# EasyEDA Pro project ran-pang-airlink-86231b34.epro, schematic Schematic1_6, sheets 1 to 3 of 9

## Sheets
1 SOC: Board Name: 主控板; Create Date: 2025-08-27; Page Name: SOC; Project Name: 无线USB集线器-SG2002; Schematic Name: Schematic1_1; Update Date: 2025-10-29; Page Size: A4; Version: V1.0
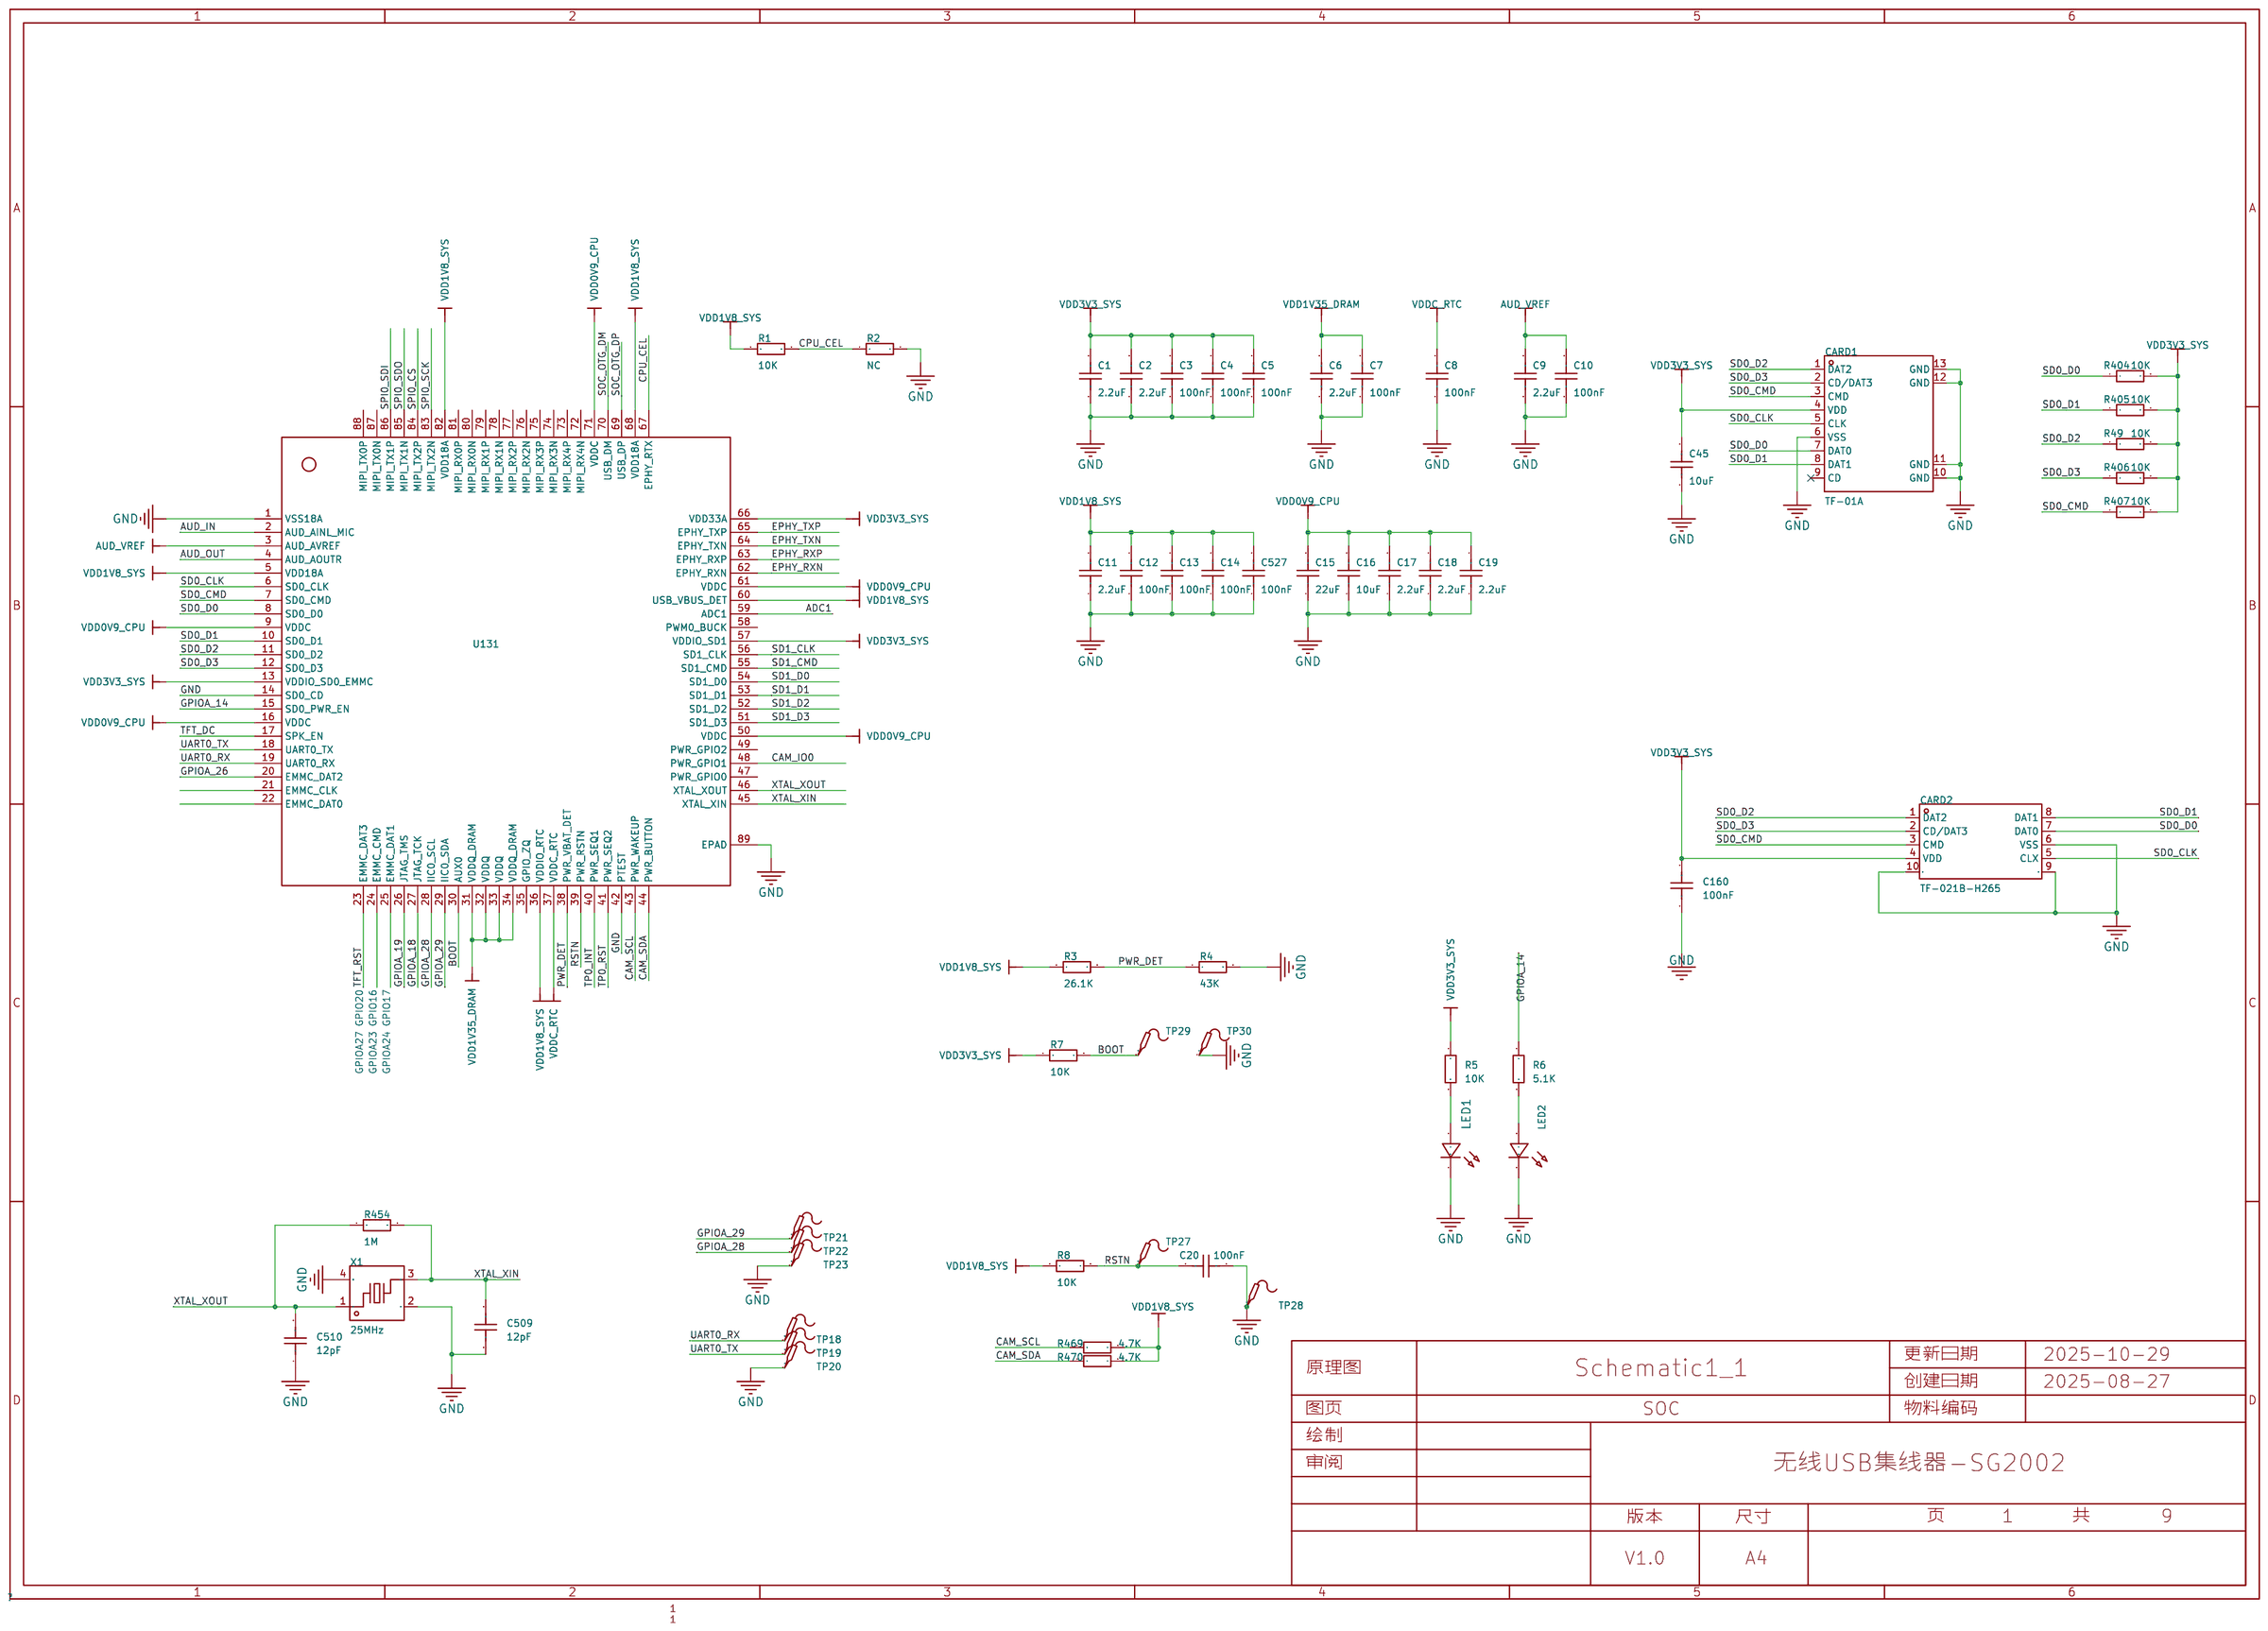
[diagram p0: SOC]
2 POWER: Page Name: POWER; Update Date: 2025-10-30
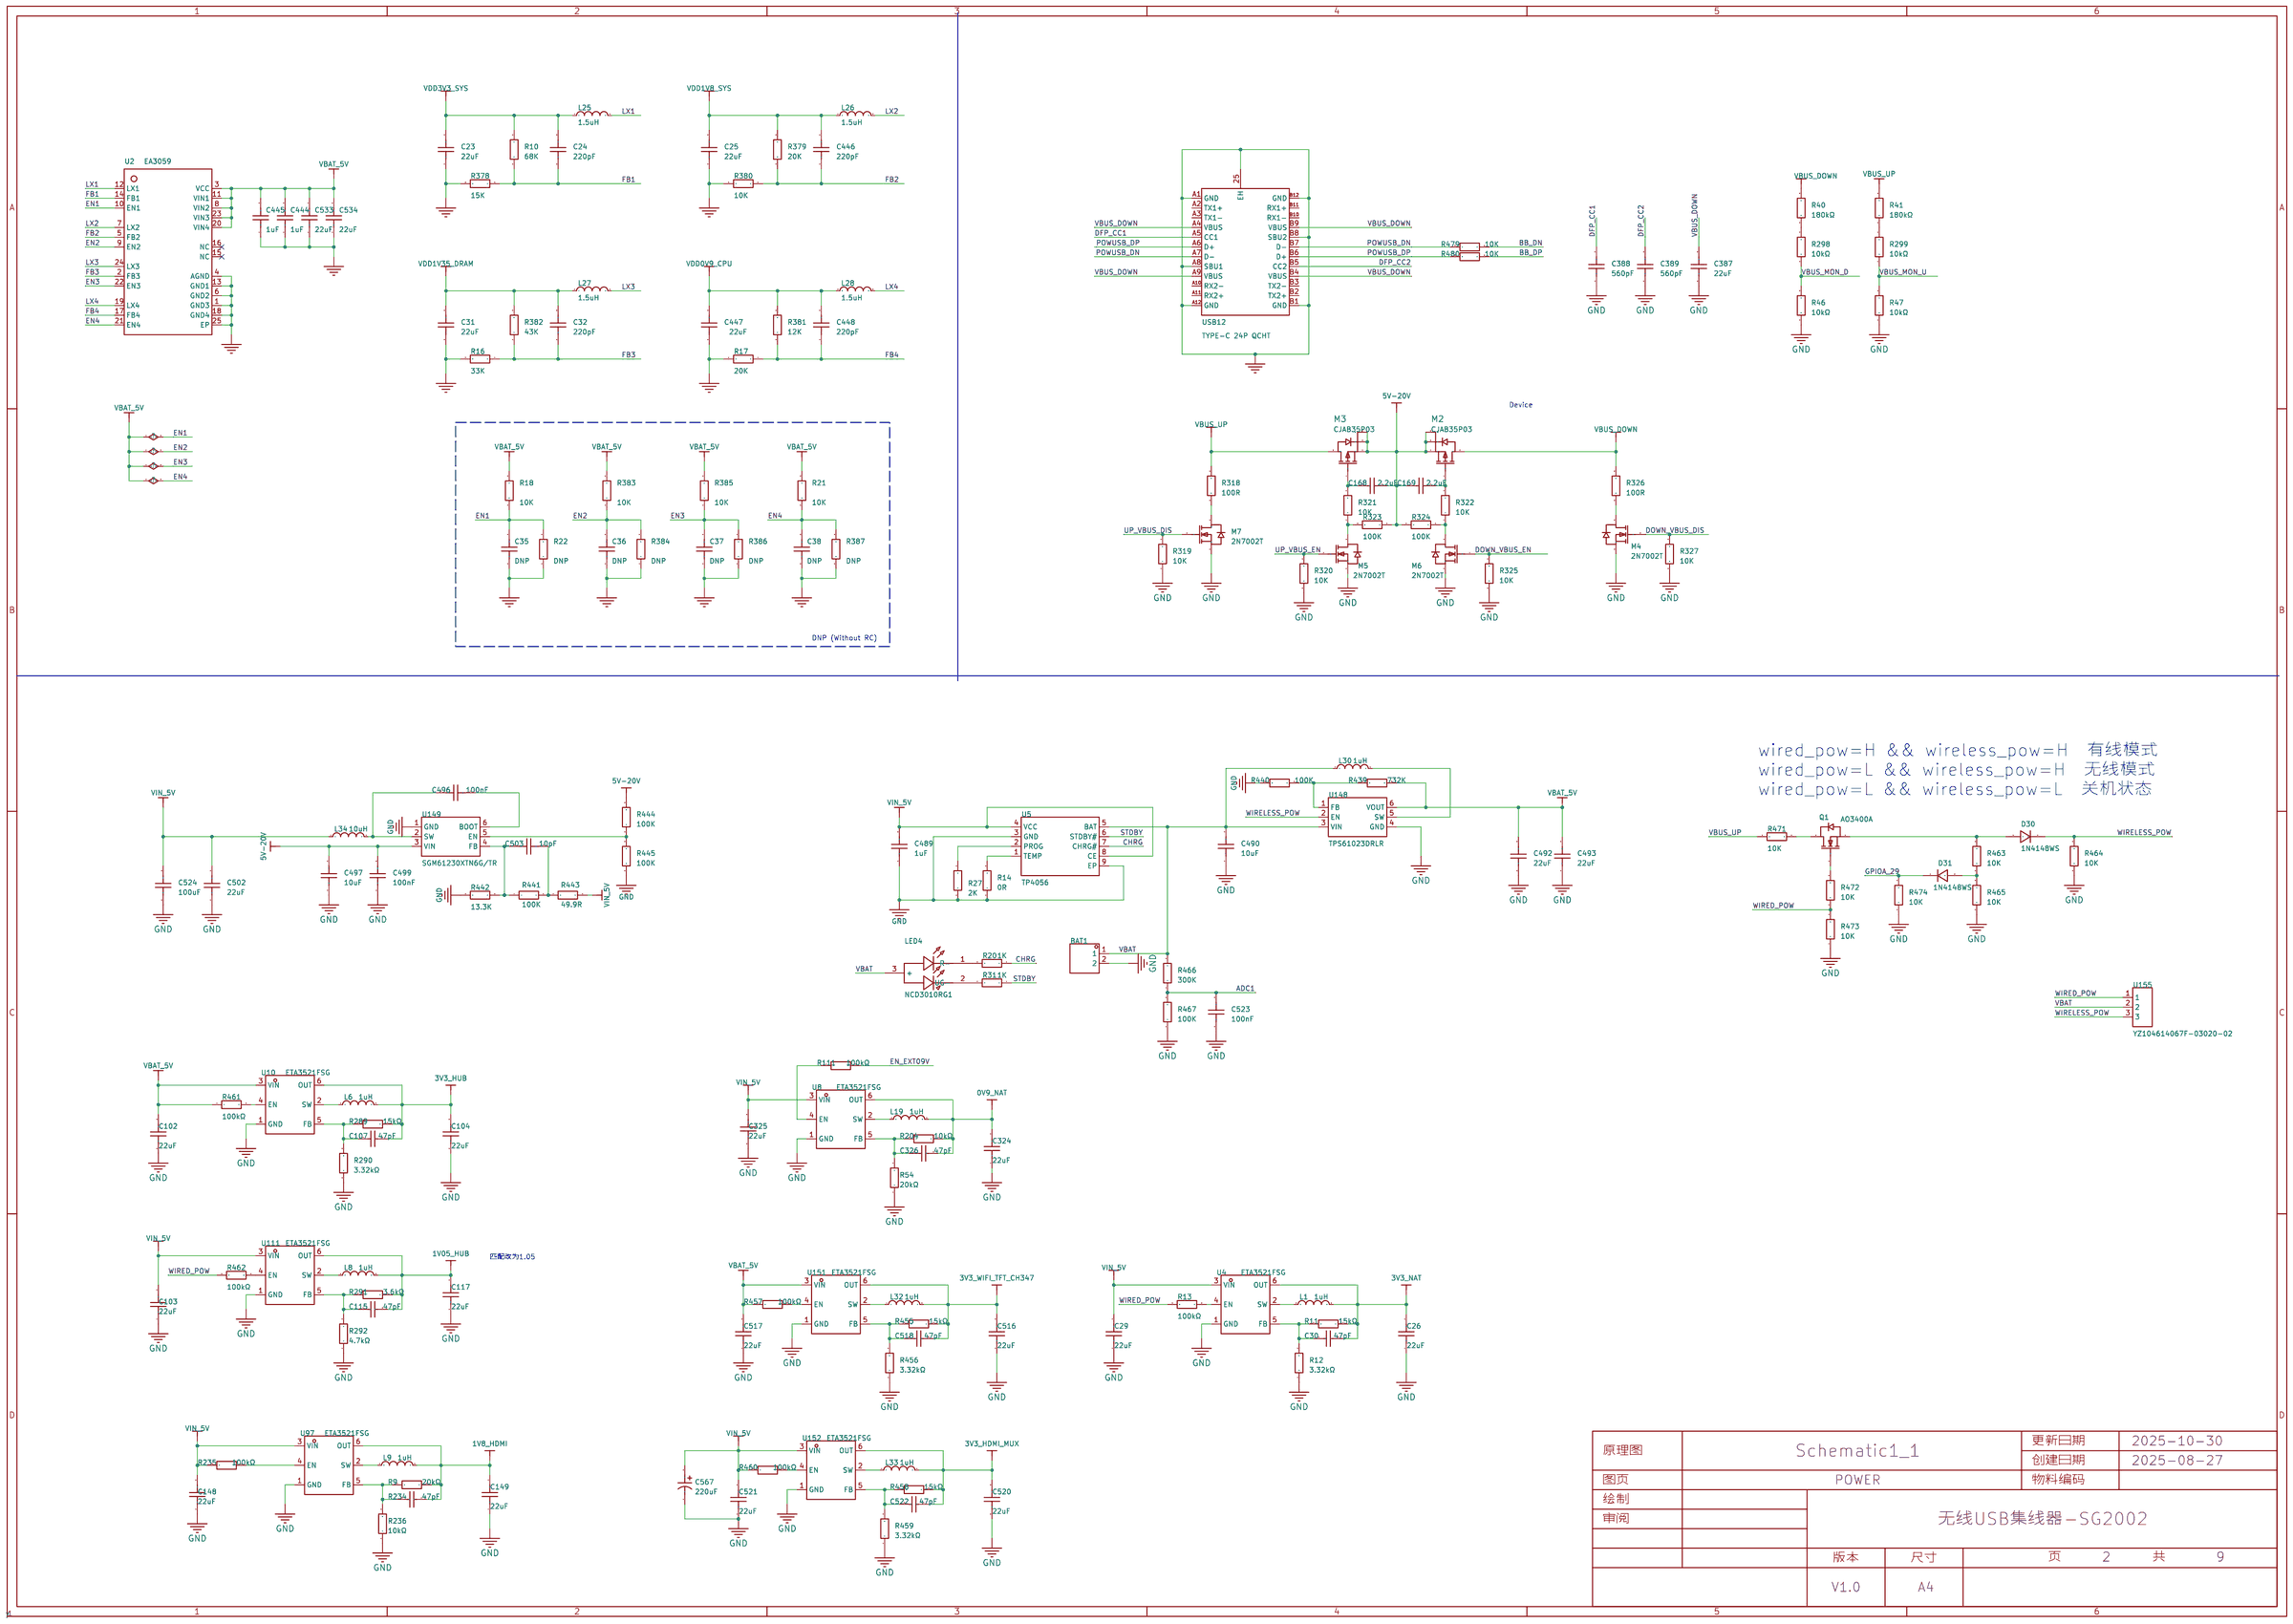
[diagram p1: POWER]
3 WIFI: Page Name: WIFI; Update Date: 2025-09-01
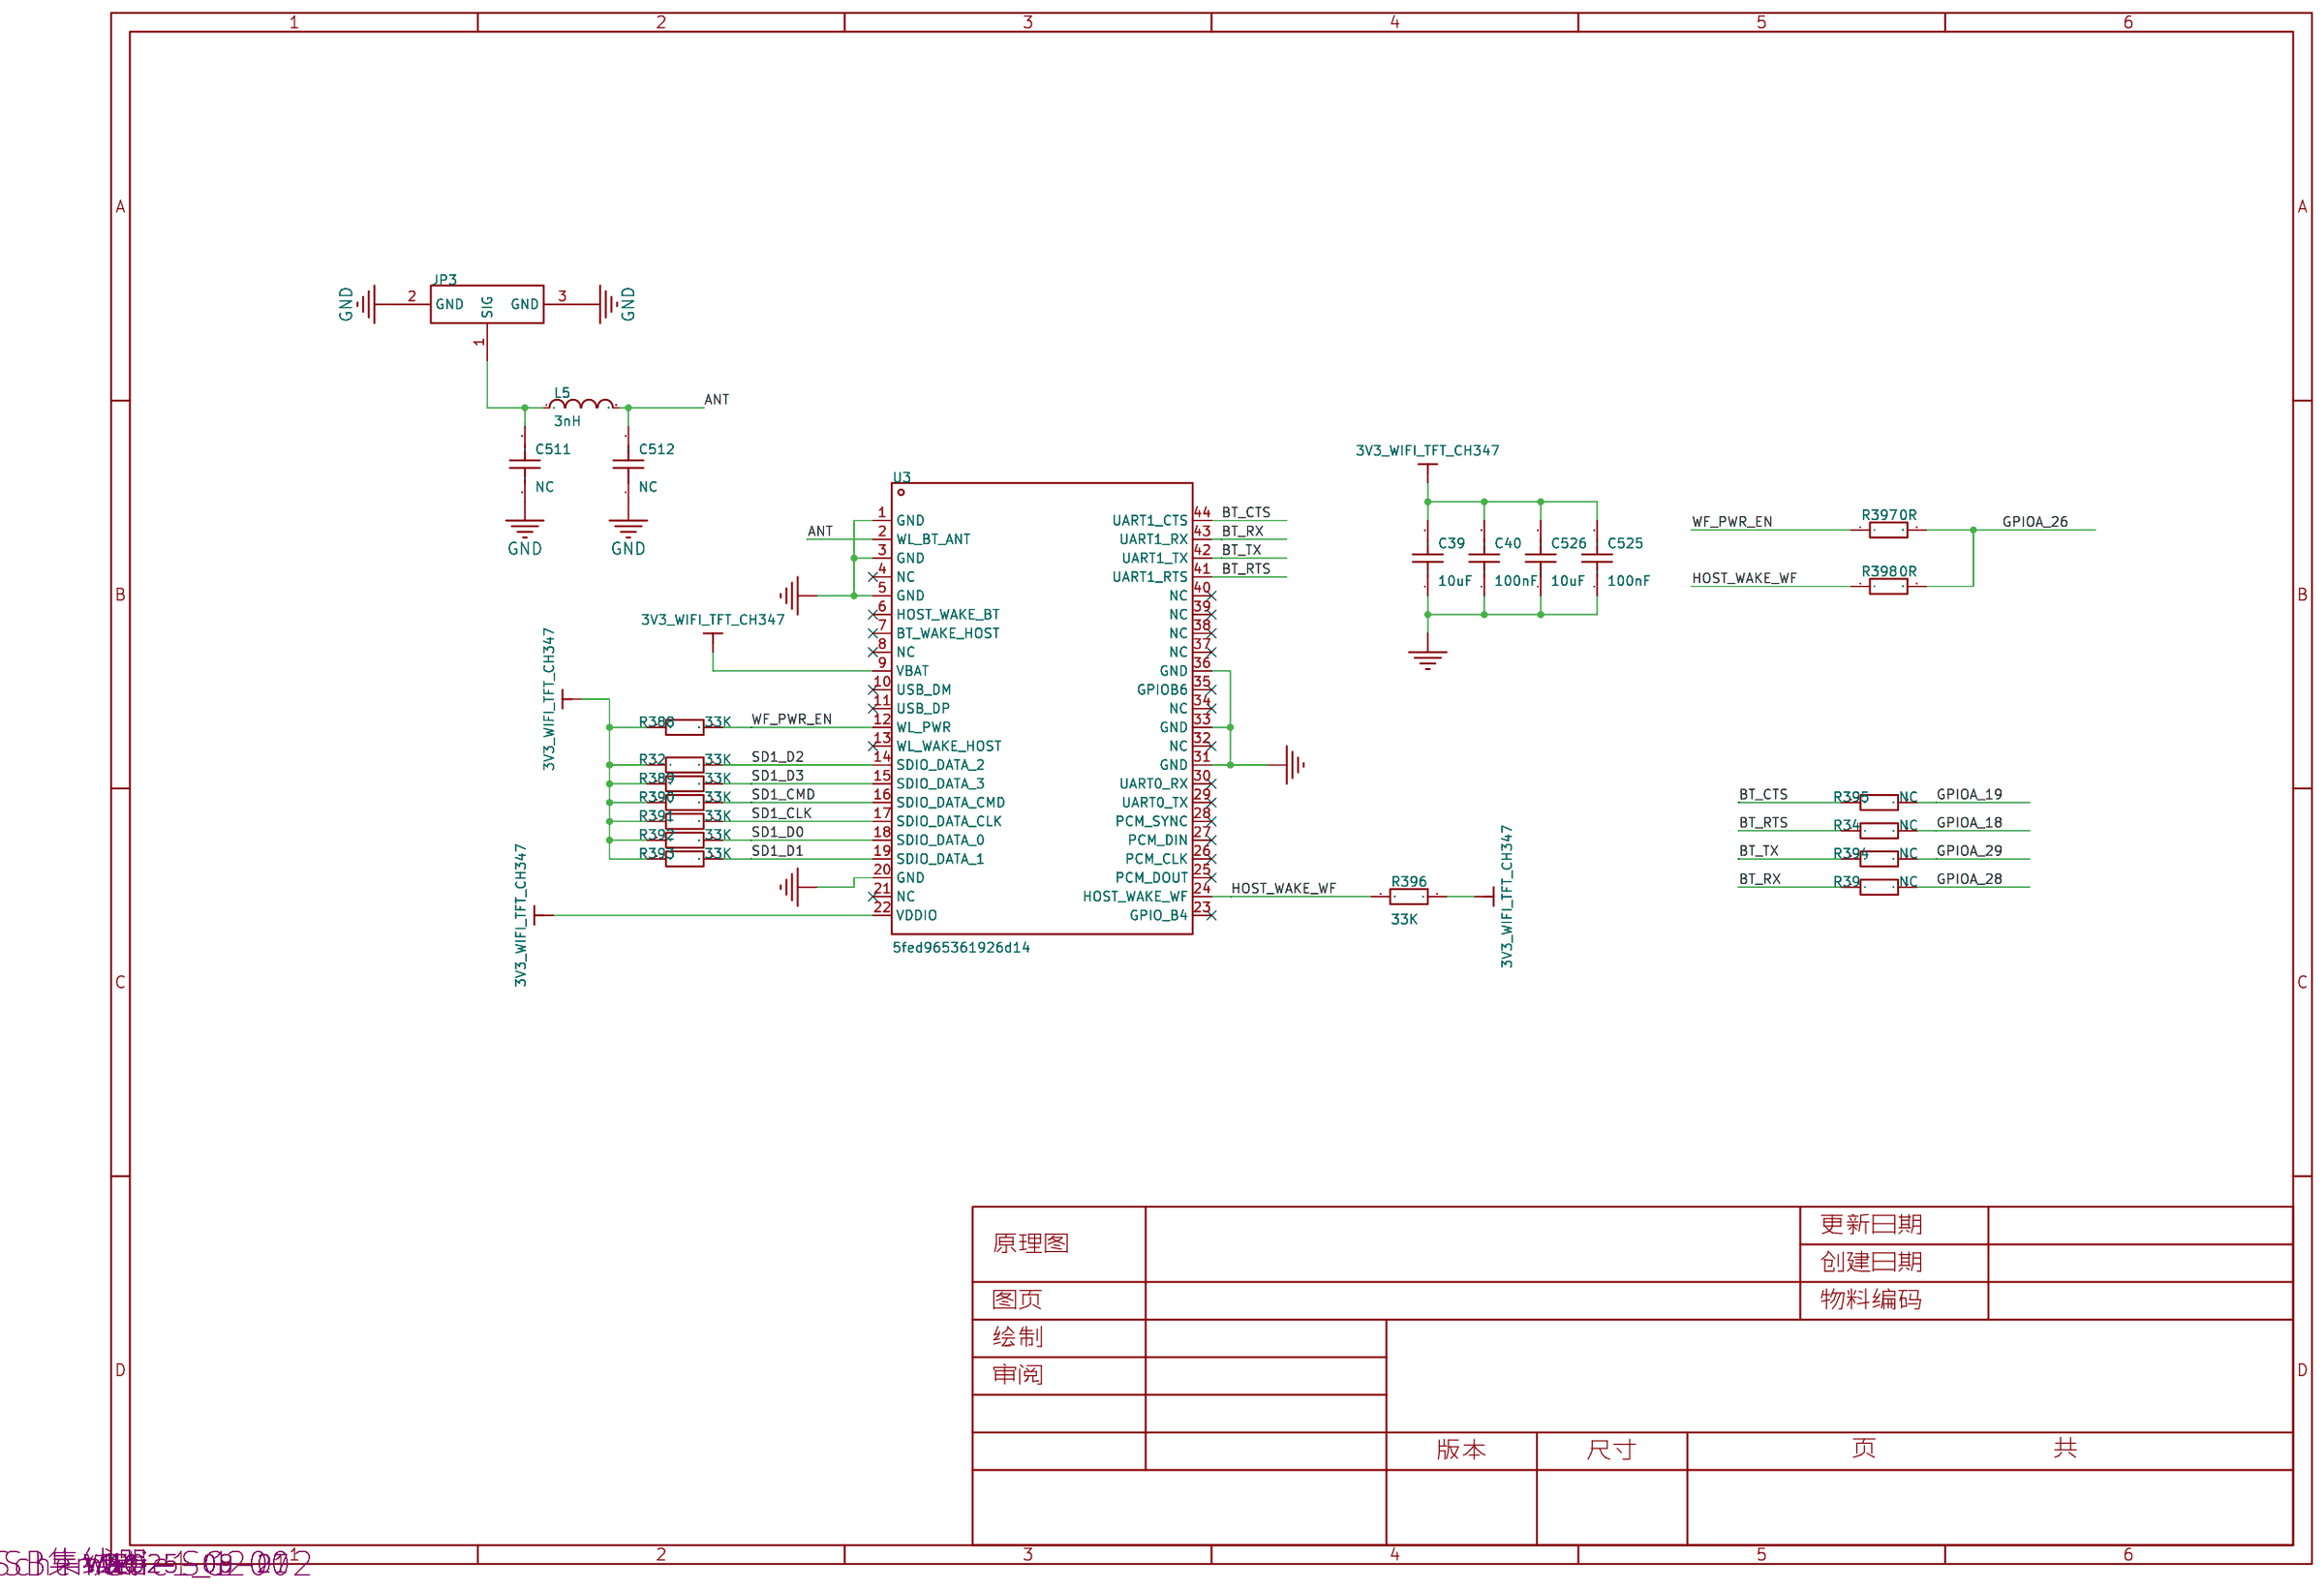
[diagram p2: WIFI]

## Parts
sheet POWER
BAT1  -  [HDR-TH_2P-P2.54-V-M-1]
C23  22uF  [C0603]
C24  220pF  [C0402]  (no BOM)
C25  22uF  [C0603]
C26  22uF  [C0603]
C29  22uF  [C0603]
C30  47pF  [R0402]
C31  22uF  [C0603]
C32  220pF  [C0402]  (no BOM)
C35  DNP  [C0402]  (no BOM)
C36  DNP  [C0402]  (no BOM)
C37  DNP  [C0402]  (no BOM)
C38  DNP  [C0402]  (no BOM)
C102  22uF  [C0603]
C103  22uF  [C0603]  (no BOM)
C104  22uF  [C0603]
C107  47pF  [R0402]
C115  47pF  [R0402]  (no BOM)
C117  22uF  [C0603]  (no BOM)
C148  22uF  [C0603]
C149  22uF  [C0603]
C168  2.2uF  [R0402]
C169  2.2uF  [R0402]
C324  22uF  [C0603]  (no BOM)
C325  22uF  [C0603]  (no BOM)
C326  47pF  [R0402]  (no BOM)
C387  22uF  [C0805]
C388  560pF  [C0402]
C389  560pF  [C0402]
C444  1uF  [C0402]
C445  1uF  [C0402]
C446  220pF  [C0402]  (no BOM)
C447  22uF  [C0603]
C448  220pF  [C0402]  (no BOM)
C489  1uF  [C0402]
C490  10uF  [C0402]
C492  22uF  [C0603]
C493  22uF  [C0603]
C496  100nF  [C0402]
C497  10uF  [C0603]
C499  100nF  [C0402]
C502  22uF  [C0603]
C503  10pF  [C0402]
C516  22uF  [C0603]
C517  22uF  [C0603]
C518  47pF  [R0402]
C520  22uF  [C0603]
C521  22uF  [C0603]
C522  47pF  [R0402]
C523  100nF  [C0402]
C524  100uF  [C1206]
C533  22uF  [C0402]
C534  22uF  [C0402]
C567  220uF  [CAP-SMD_L7.3-W4.3-RD_177EC0013]
D30  1N4148WS  [SOD-323_L1.8-W1.3-LS2.5-RD]
D31  1N4148WS  [SOD-323_L1.8-W1.3-LS2.5-RD]
L1  1uH  [IND-SMD_L2.5-W2.0-VLS252012CX-150M]
L6  1uH  [IND-SMD_L2.5-W2.0-VLS252012CX-150M]
L8  1uH  [IND-SMD_L2.5-W2.0-VLS252012CX-150M]  (no BOM)
L9  1uH  [IND-SMD_L2.5-W2.0-VLS252012CX-150M]
L19  1uH  [IND-SMD_L2.5-W2.0-VLS252012CX-150M]  (no BOM)
L25  1.5uH  [IND-SMD_L2.5-W2.0_YXMBL252010P]
L26  1.5uH  [IND-SMD_L2.5-W2.0_YXMBL252010P]
L27  1.5uH  [IND-SMD_L2.5-W2.0_YXMBL252010P]
L28  1.5uH  [IND-SMD_L2.5-W2.0_YXMBL252010P]
L30  1uH  [IND-SMD_L2.5-W2.0-VLS252012CX-150M]
L32  1uH  [IND-SMD_L2.5-W2.0-VLS252012CX-150M]
L33  1uH  [IND-SMD_L2.5-W2.0-VLS252012CX-150M]
L34  10uH  [IND-SMD_L3.2-W2.5_CKST322512-2.2UH]
LED4  NCD3010RG1  [LED-SMD_NCD3010RG1]
M2  CJAB35P03  [POWERDI3333-8_DMN7022LFGQ-7]
M3  CJAB35P03  [POWERDI3333-8_DMN7022LFGQ-7]
M4  2N7002T  [SC-75-3_L1.6-W0.8-P1.00-LS1.7-BR]
M5  2N7002T  [SC-75-3_L1.6-W0.8-P1.00-LS1.7-BR]
M6  2N7002T  [SC-75-3_L1.6-W0.8-P1.00-LS1.7-BR]
M7  2N7002T  [SC-75-3_L1.6-W0.8-P1.00-LS1.7-BR]
Q1  AO3400A  [SOT-23-3_L2.9-W1.3-P1.90-LS2.4-BR]
R9  20kΩ  [R0402]
R10  68K  [R0402]
R11  15kΩ  [R0402]
R12  3.32kΩ  [R0402]
R13  100kΩ  [R0402]
R14  0R  [R0402]
R16  33K  [R0402]
R17  20K  [R0402]
R18  10K  [R0402]  (no BOM)
R20  1K  [R0402]
R21  10K  [R0402]  (no BOM)
R22  DNP  [R0402]  (no BOM)
R27  2K  [R0402]
R31  1K  [R0402]
R40  180kΩ  [R0402]
R41  180kΩ  [R0402]
R46  10kΩ  [R0402]
R47  10kΩ  [R0402]
R54  20kΩ  [R0402]  (no BOM)
R111  100kΩ  [R0402]  (no BOM)
R204  10kΩ  [R0402]  (no BOM)
R234  47pF  [R0402]
R235  100kΩ  [R0402]
R236  10kΩ  [R0402]
R289  15kΩ  [R0402]
R290  3.32kΩ  [R0402]
R291  3.6kΩ  [R0402]  (no BOM)
R292  4.7kΩ  [R0402]  (no BOM)
R298  10kΩ  [R0402]
R299  10kΩ  [R0402]
R318  100R  [R0603]
R319  10K  [R0402]
R320  10K  [R0402]
R321  10K  [R0402]
R322  10K  [R0402]
R323  100K  [R0402]
R324  100K  [R0402]
R325  10K  [R0402]
R326  100R  [R0603]
R327  10K  [R0402]
R378  15K  [R0402]
R379  20K  [R0402]
R380  10K  [R0402]
R381  12K  [R0402]
R382  43K  [R0402]
R383  10K  [R0402]  (no BOM)
R384  DNP  [R0402]  (no BOM)
R385  10K  [R0402]  (no BOM)
R386  DNP  [R0402]  (no BOM)
R387  DNP  [R0402]  (no BOM)
R439  732K  [R0402]
R440  100K  [R0402]
R441  100K  [R0402]
R442  13.3K  [R0402]
R443  49.9R  [R0402]
R444  100K  [R0402]
R445  100K  [R0402]
R455  15kΩ  [R0402]
R456  3.32kΩ  [R0402]
R457  100kΩ  [R0402]
R458  15kΩ  [R0402]
R459  3.32kΩ  [R0402]
R460  100kΩ  [R0402]
R461  100kΩ  [R0402]
R462  100kΩ  [R0402]  (no BOM)
R463  10K  [R0402]
R464  10K  [R0402]
R465  10K  [R0402]
R466  300K  [R0402]
R467  100K  [R0402]
R471  10K  [R0402]
R472  10K  [R0402]
R473  10K  [R0402]
R474  10K  [R0402]
R479  10K  [R0402]
R480  10K  [R0402]
U2  EA3059  [VQFN-24_L4.0-W4.0-P0.50-TL-EP2.5]
U4  ETA3521FSG  [SOT-563-6_L1.6-W1.2-P0.5-LS1.6-BL]
U5  TP4056  [ESOP-8_L4.9-W3.9-P1.27-LS6.0-BL-EP]
U8  ETA3521FSG  [SOT-563-6_L1.6-W1.2-P0.5-LS1.6-BL]  (no BOM)
U10  ETA3521FSG  [SOT-563-6_L1.6-W1.2-P0.5-LS1.6-BL]
U97  ETA3521FSG  [SOT-563-6_L1.6-W1.2-P0.5-LS1.6-BL]
U111  ETA3521FSG  [SOT-563-6_L1.6-W1.2-P0.5-LS1.6-BL]  (no BOM)
U148  TPS61023DRLR  [SOT-563_L1.6-W1.2-P0.50-LS1.6-BR]
U149  SGM61230XTN6G/TR  [SOT-23-6_L2.9-W1.6-P0.95-LS2.8-BR]
U151  ETA3521FSG  [SOT-563-6_L1.6-W1.2-P0.5-LS1.6-BL]
U152  ETA3521FSG  [SOT-563-6_L1.6-W1.2-P0.5-LS1.6-BL]
U155  YZ104614067F-03020-02  [CONN-SMD_YZ104614067F-03020-02]
USB12  TYPE-C 24P QCHT  [TYPE-C-SMD_TYPE-C-24P-QCHT]
sheet SOC
C1  2.2uF  [C0402]
C2  2.2uF  [C0402]
C3  100nF  [C0402]
C4  100nF  [C0402]
C5  100nF  [C0402]
C6  2.2uF  [C0402]
C7  100nF  [C0402]
C8  100nF  [C0402]
C9  2.2uF  [C0402]
C10  100nF  [C0402]
C11  2.2uF  [C0402]
C12  100nF  [C0402]
C13  100nF  [C0402]
C14  100nF  [C0402]
C15  22uF  [C0603]
C16  10uF  [C0603]
C17  2.2uF  [C0402]
C18  2.2uF  [C0402]
C19  2.2uF  [C0402]
C20  100nF  [C0402]
C45  10uF  [C0603]  (no BOM)
C160  100nF  [C0402]
C509  12pF  [C0402]
C510  12pF  [C0402]
C527  100nF  [C0402]
CARD1  TF-01A  [TF-SMD_TF-02]  (no BOM)
CARD2  TF-021B-H265  [TF-SMD_TF-021B-H265]
LED1  -  [LED_0402]
LED2  -  [LED_0402]
R1  10K  [R0402]
R2  NC  [R0402]
R3  26.1K  [R0402]
R4  43K  [R0402]
R5  10K  [R0402]
R6  5.1K  [R0402]
R7  10K  [R0402]
R8  10K  [R0402]
R49  10K  [R0402]  (no BOM)
R404  10K  [R0402]  (no BOM)
R405  10K  [R0402]  (no BOM)
R406  10K  [R0402]  (no BOM)
R407  10K  [R0402]  (no BOM)
R454  1M  [R0402]
R469  4.7K  [R0402]
R470  4.7K  [R0402]
TP18  -  [Test-Point-0.5mm]
TP19  -  [Test-Point-0.5mm]
TP20  -  [Test-Point-0.5mm]
TP21  -  [Test-Point-0.5mm]
TP22  -  [Test-Point-0.5mm]
TP23  -  [Test-Point-0.5mm]
TP27  -  [Test-Point-0.5mm]
TP28  -  [Test-Point-0.5mm]
TP29  -  [Test-Point-0.5mm]
TP30  -  [Test-Point-0.5mm]
U131  de476d111a8f50c6  [QFN-88_L9.0-W9.0-P0.35-TL-EP7.0]
X1  25MHz  [CRYSTAL-SMD_4P-L2.0-W1.6-BL]
sheet WIFI
C39  10uF  [C0603]
C40  100nF  [C0402]
C511  NC  [C0402]
C512  NC  [C0402]
C525  100nF  [C0402]
C526  10uF  [C0603]
JP3  U.FL-R-SMT-1(80)  [RF-SMD_FRF05002-JSS103M]
L5  3nH  [L0402]
R32  33K  [R0402]
R34  NC  [R0402]  (no BOM)
R39  NC  [R0402]  (no BOM)
R388  33K  [R0402]
R389  33K  [R0402]
R390  33K  [R0402]
R391  33K  [R0402]
R392  33K  [R0402]
R393  33K  [R0402]
R394  NC  [R0402]  (no BOM)
R395  NC  [R0402]  (no BOM)
R396  33K  [R0402]
R397  0R  [R0402]
R398  0R  [R0402]
U3  5fed965361926d14  [QFN-44_L12.0-W12.0-WiFi]

## Library data of the parts
BAT1 = HDR-M_2.54_1x2P: Supplier Part: C124375; Supplier Footprint: 插件
C15 C16 C23 C25 C31 C39 C45 C447 C492 C493 C497 C502 C526 = CAP_0603: Supplier Footprint: 0603
C1-C14 C17-C20 C24 C32 C35-C38 C40 C160 C388 C389 C444-C446 C448 C489 C490 C496 C499 C503 C509-C512 C523 C525 C527 C533 C534 = CAP_0402: Supplier Footprint: 0402
C26 C29 C102-C104 C117 C148 C149 C324 C325 C516 C517 C520 C521 = CL10A226MP8NUNE: 容值:22uF;精度:±20%;额定电压:10V;材质(温度系数):X5R;; LCSC Part Name: 22uF ±20% 10V; Supplier Part: C86295; Manufacturer: SAMSUNG(三星); Supplier Footprint: 0603; JLCPCB Part Class: 扩展库; Datasheet: https://atta.szlcsc.com/upload/public/pdf/source/20160218/1457707763339.pdf; Supplier: LCSC; Tolerance: ±20%; Voltage Rated: 10V; Temperature Coefficient: X5R
C30 C107 C115 C326 C518 C522 R234 = GRM1555C1H470JA01D: 容值:47pF;精度:±5%;额定电压:50V;材质(温度系数):C0G;; LCSC Part Name: 47pF ±5% 50V; Supplier Part: C76970; Manufacturer: muRata(村田); Supplier Footprint: 0402; JLCPCB Part Class: Extended Part; Datasheet: https://atta.szlcsc.com/upload/public/pdf/source/20180326/C76970_6FDF160D4C40A32DF03646FA34DB0595.pdf; Supplier: LCSC; Tolerance: ±5%; Voltage Rated: 50V; Temperature Coefficient: C0G
C168 C169 = CL05A105KP5NNNC: 容值:1uF;精度:±10%;额定电压:10V;材质(温度系数):X5R;; LCSC Part Name: 1uF ±10% 10V; Supplier Part: C14445; Manufacturer: SAMSUNG(三星); Supplier Footprint: 0402; JLCPCB Part Class: Extended Part; Datasheet: https://atta.szlcsc.com/upload/public/pdf/source/20160218/1457707763339.pdf; Supplier: LCSC; Tolerance: ±10%; Voltage Rated: 10V; Temperature Coefficient: X5R
C387 = CAP_0805: Supplier Footprint: 0805
C524 = HGC1206R5107M100NSPJ: 容值:100uF;精度:±20%;额定电压:10V;温度系数:X5R;; LCSC Part Name: 100uF ±20% 10V; Supplier Part: C7432784; Manufacturer: Chinocera(华瓷); Supplier Footprint: 1206; JLCPCB Part Class: Extended Part; Datasheet: https://atta.szlcsc.com/upload/public/pdf/source/20240320/FAC3FEC40A78BC5CCCE96C232A94D860.pdf; Supplier: LCSC; Tolerance: ±20%; Voltage Rating: 10V; Temperature Coefficient: X5R
C567 = TA6R3M220A: 容值:220uF;精度:±20%;额定电压:6.3V;等效串联电阻(ESR):18mΩ@100kHz;; LCSC Part Name: 220uF ±20% 6.3V; Supplier Part: C49332975; Manufacturer: JIERR(捷而瑞); Supplier Footprint: CASE-A-7343-19(mm); JLCPCB Part Class: Extended Part; Datasheet: https://item.szlcsc.com/datasheet/TA6R3M220A/51817329.html; Supplier: LCSC; Tolerance: ±20%; Voltage Rating: 6.3V; Current - Leakage: 138.6uA@20℃,2min; Ripple Current: 5.1A@100kHz; Equivalent Series Resistance(ESR): 18mΩ@100kHz; Operating Temperature: -55℃~+105℃
D30 D31 = 1N4148WS_C2128: 二极管配置:独立式;正向压降(Vf):1.25V@150mA;直流反向耐压(Vr):100V;整流电流:150mA;反向恢复时间(Trr):4ns;; LCSC Part Name: 丝印T4 1N4148WS; Supplier Part: C2128; Manufacturer: CJ(江苏长电/长晶); Supplier Footprint: SOD-323; JLCPCB Part Class: Basic Part; Datasheet: https://item.szlcsc.com/datasheet/1N4148WS/2485.html; Supplier: LCSC; Diode Configuration: 独立式; Voltage - Forward(Vf@If): 1.25V@150mA; Voltage - DC Reverse(Vr): 100V; Current - Rectified: 150mA; Pd - Power Dissipation: 200mW; Reverse Leakage Current (Ir): 1uA@75V; Reverse Recovery Time (trr): 4ns; Non-Repetitive Peak Forward Surge Current: 2A
L1 L6 L8 L9 L19 L30 L32 L33 = FTC252012S1R0MBCA: 电感值:1uH;精度:±20%;额定电流:4A;饱和电流(Isat):5.6A;类型:一体成型电感;; LCSC Part Name: 1uH ±20% 5.6A; Supplier Part: C5832370; Manufacturer: cjiang(长江微电); Supplier Footprint: SMD,2x2.5mm; JLCPCB Part Class: 扩展库; Datasheet: https://atta.szlcsc.com/upload/public/pdf/source/20230602/8FFEDA9C0247A92A0D4B67554BFE4091.pdf; Supplier: LCSC; Tolerance: ±20%; Rated Current: 4A; Saturation Current (Isat): 5.6A; DC Resistance (DCR): 35mΩ; Type: 一体成型电感
L25-L28 = FWP252010P-1R5ML: 电感值:1.5uH;精度:±20%;额定电流:2.5A;饱和电流(Isat):2.6A;类型:一体成型电感;; LCSC Part Name: 1.5uH ±20% 2.6A; Supplier Part: C5179452; Manufacturer: cjiang(长江微电); Supplier Footprint: 1008; Datasheet: https://atta.szlcsc.com/upload/public/pdf/source/20220919/6437779B41DFA72ADCBB2BAC61339FA9.pdf; Supplier: LCSC; Tolerance: ±20%; Rated Current: 2.5A; Saturation Current (Isat): 2.6A; DC Resistance (DCR): 76mΩ; Type: 一体成型电感
L34 = XRTC322512S100MBCA: 电感值:10uH;精度:±20%;额定电流:2.2A;饱和电流(Isat):2.3A;类型:一体成型电感;; LCSC Part Name: 10uH ±20% 2.3A; Supplier Part: C39846661; Manufacturer: XR(祥如); Supplier Footprint: 1210; JLCPCB Part Class: Extended Part; Datasheet: https://atta.szlcsc.com/upload/public/pdf/source/20240812/C16E8F0C73C405E9D3CCCD49A6B54F40.pdf; Supplier: LCSC; Tolerance: ±20%; Current Rating: 2.2A; Current - Saturation(Isat): 2.3A; DC Resistance(DCR): 210mΩ; Type: 一体成型电感
LED4 = NCD3010RG1: 发光颜色:橙红色,翠绿色;正向压降(Vf):3V；2V;功率:90mW；65mW;正向电流:25mA;波长:625nm；530nm;二极管配置:共阳极;透镜颜色:-;色温:-;发光强度:180mcd；270mcd;发光角度:120°;载带方式:侧贴;工作温度:-30℃~+85℃;; LCSC Part Name: 片式发光二极管; Supplier Part: C2917189; Manufacturer: 国星光电; Supplier Footprint: SMD,3x2mm; JLCPCB Part Class: Extended Part; Datasheet: https://item.szlcsc.com/datasheet/NCD3010RG1/3215928.html; Supplier: LCSC; Illumination Color: 橙红色,翠绿色; Voltage - Forward(Vf): 3V；2V; Power(Watts): 90mW；65mW; Forward Current: 25mA; Wavelength - Dominant: 625nm；530nm; Diode Configuration: 共阳极; Luminous Intensity: 180mcd；270mcd; Viewing Angle: 120°; Mounting Style: 侧贴; Operating Temperature: -30℃~+85℃
M2 M3 = AONR21357_C17702945: 类型:1个P沟道;漏源电压(Vdss):30V;连续漏极电流(Id):50A;导通电阻(RDS(on)@Vgs,Id):13mΩ@10V;阈值电压(Vgs(th)@Id):2.5V;; LCSC Part Name: 1个P沟道 耐压:30V 电流:50A; Supplier Part: C17702945; Manufacturer: MSKSEMI(美森科); Supplier Footprint: DFN3x3-8L; JLCPCB Part Class: Extended Part; Datasheet: https://atta.szlcsc.com/upload/public/pdf/source/20230927/8E319A2206C95A80892B1C001B0B7090.pdf; Supplier: LCSC; Type: 1个P沟道; Drain Source Voltage (Vdss): 30V; Continuous Drain Current (Id): 50A; Drain Source On Resistance (RDS(on)@Vgs,Id): 13mΩ@10V; Gate Threshold Voltage (Vgs(th)@Id): 2.5V
M4-M7 = 2N7002T_C40106: 类型:1个N沟道;漏源电压(Vdss):60V;连续漏极电流(Id):115mA;功率(Pd):200mW;导通电阻(RDS(on)@Vgs,Id):7.5Ω@5V,50mA;阈值电压(Vgs(th)@Id):2V@250uA;; LCSC Part Name: 1个N沟道 耐压:60V 电流:115mA; Supplier Part: C40106; Manufacturer: CJ(江苏长电/长晶); Supplier Footprint: SC-75(SOT-523); JLCPCB Part Class: 扩展库; Datasheet: https://atta.szlcsc.com/upload/public/pdf/source/20141219/1457707256656.pdf; Supplier: LCSC; Type: 1个N沟道; Drain Source Voltage (Vdss): 60V; Continuous Drain Current (Id): 115mA; Power Dissipation (Pd): 200mW; Drain Source On Resistance (RDS(on)@Vgs,Id): 7.5Ω@5V,50mA; Gate Threshold Voltage (Vgs(th)@Id): 2V@250uA
Q1 = AO3400A_C20917: 数量:-;漏源电压(Vdss):30V;连续漏极电流(Id):-;导通电阻(RDS(on)):48mΩ@2.5V;耗散功率(Pd):-;阈值电压(Vgs(th)):1.45V@250uA;; LCSC Part Name: 1个N沟道 耐压:30V 电流:5.7A; Supplier Part: C20917; Manufacturer: AOS; Supplier Footprint: SOT-23-3L; JLCPCB Part Class: Basic Part; Datasheet: https://item.szlcsc.com/datasheet/AO3400A/21629.html; Supplier: LCSC; Drain to Source Voltage: 30V; RDS(on): 48mΩ@2.5V; Gate Threshold Voltage (Vgs(th)): 1.45V@250uA; Gate Charge(Qg): 7nC@10V; Input Capacitance(Ciss): 630pF@15V; Operating Temperature: -55℃~+150℃@(Tj); Type: N沟道
R9 = 0402WGF2002TCE: 电阻类型:厚膜电阻;阻值:20kΩ;精度:±1%;功率:62.5mW;最大工作电压:50V;温度系数:±100ppm/℃;; LCSC Part Name: 20kΩ ±1% 62.5mW 厚膜电阻; Supplier Part: C25765; Manufacturer: UNI-ROYAL(厚声); Supplier Footprint: 0402; JLCPCB Part Class: Basic Part; Datasheet: https://atta.szlcsc.com/upload/public/pdf/source/20200306/C422600_1E6D84923E4A46A82E41ADD87F860B5C.pdf; Supplier: LCSC; Type: 厚膜电阻; Tolerance: ±1%; Power(Watts): 62.5mW; Overload Voltage (Max): 50V; Temperature Coefficient: ±100ppm/℃; Operating Temperature Range: -55℃~+155℃
R1-R8 R10 R14 R16-R18 R20-R22 R27 R31 R32 R34 R39 R49 R319-R325 R327 R378-R398 R404-R407 R439-R445 R454 R463-R467 R469-R474 R479 R480 = Res_0402: Supplier Footprint: 0402
R11 R289 R455 R458 = 0402WGF1502TCE: 电阻类型:厚膜电阻;阻值:15kΩ;精度:±1%;功率:62.5mW;最大工作电压:50V;温度系数:±100ppm/℃;; LCSC Part Name: 15kΩ ±1% 62.5mW 厚膜电阻; Supplier Part: C25756; Manufacturer: UNI-ROYAL(厚声); Supplier Footprint: 0402; JLCPCB Part Class: 基础库; Datasheet: https://atta.szlcsc.com/upload/public/pdf/source/20200306/C422600_1E6D84923E4A46A82E41ADD87F860B5C.pdf; Supplier: LCSC; Type: 厚膜电阻; Tolerance: ±1%; Power(Watts): 62.5mW; Overload Voltage (Max): 50V; Temperature Coefficient: ±100ppm/℃; Operating Temperature Range: -55℃~+155℃
R12 R290 R456 R459 = 0402WGF3321TCE: 电阻类型:厚膜电阻;阻值:3.32kΩ;精度:±1%;功率:62.5mW;最大工作电压:50V;温度系数:±100ppm/℃;; LCSC Part Name: 3.32kΩ ±1% 62.5mW 厚膜电阻; Supplier Part: C60075; Manufacturer: UNI-ROYAL(厚声); Supplier Footprint: 0402; JLCPCB Part Class: 扩展库; Datasheet: https://atta.szlcsc.com/upload/public/pdf/source/20200306/C422600_1E6D84923E4A46A82E41ADD87F860B5C.pdf; Supplier: LCSC; Type: 厚膜电阻; Tolerance: ±1%; Power(Watts): 62.5mW; Overload Voltage (Max): 50V; Temperature Coefficient: ±100ppm/℃; Operating Temperature Range: -55℃~+155℃
R13 R111 R235 R457 R460-R462 = RC0402FR-07100KL: 电阻类型:厚膜电阻;阻值:100kΩ;精度:±1%;功率:62.5mW;; LCSC Part Name: 100kΩ ±1% 62.5mW; Supplier Part: C60491; Manufacturer: YAGEO(国巨); Supplier Footprint: 0402; JLCPCB Part Class: Extended Part; Datasheet: https://atta.szlcsc.com/upload/public/pdf/source/20170518/1495086055123.pdf; Supplier: LCSC; Type: 厚膜电阻; Tolerance: ±1%; Power(Watts): 62.5mW; Temperature Coefficient: ±100ppm/℃; Overload Voltage (Max): 50V; Operating Temperature Range: -55℃~+155℃
R40 R41 = 0402WGF1803TCE: 电阻类型:厚膜电阻;阻值:180kΩ;精度:±1%;功率:62.5mW;最大工作电压:50V;温度系数:±100ppm/℃;; LCSC Part Name: 180kΩ ±1% 62.5mW 厚膜电阻; Supplier Part: C25760; Manufacturer: UNI-ROYAL(厚声); Supplier Footprint: 0402; JLCPCB Part Class: 扩展库; Datasheet: https://atta.szlcsc.com/upload/public/pdf/source/20200306/C422600_1E6D84923E4A46A82E41ADD87F860B5C.pdf; Supplier: LCSC; Type: 厚膜电阻; Tolerance: ±1%; Power(Watts): 62.5mW; Overload Voltage (Max): 50V; Temperature Coefficient: ±100ppm/℃; Operating Temperature Range: -55℃~+155℃
R46 R47 R298 R299 = RC0402FR-0710KL: 电阻类型:厚膜电阻;阻值:10kΩ;精度:±1%;功率:62.5mW;; LCSC Part Name: 10kΩ ±1% 62.5mW; Supplier Part: C60490; Manufacturer: YAGEO(国巨); Supplier Footprint: 0402; JLCPCB Part Class: Extended Part; Datasheet: https://atta.szlcsc.com/upload/public/pdf/source/20170606/1496716515432.pdf; Supplier: LCSC; Type: 厚膜电阻; Tolerance: ±1%; Power(Watts): 62.5mW; Temperature Coefficient: ±100ppm/℃; Overload Voltage (Max): 50V; Operating Temperature Range: -55℃~+155℃
R54 = 0402WGF3301TCE: 电阻类型:厚膜电阻;阻值:3.3kΩ;精度:±1%;功率:62.5mW;最大工作电压:50V;温度系数:±100ppm/℃;; LCSC Part Name: 3.3kΩ ±1% 62.5mW 厚膜电阻; Supplier Part: C25765; Manufacturer: UNI-ROYAL(厚声); Supplier Footprint: 0402; JLCPCB Part Class: Basic Part; Datasheet: https://atta.szlcsc.com/upload/public/pdf/source/20200306/C422600_1E6D84923E4A46A82E41ADD87F860B5C.pdf; Supplier: LCSC; Type: 厚膜电阻; Tolerance: ±1%; Power(Watts): 62.5mW; Overload Voltage (Max): 50V; Temperature Coefficient: ±100ppm/℃; Operating Temperature Range: -55℃~+155℃
R204 = 0402WGF2201TCE: 电阻类型:厚膜电阻;阻值:2.2kΩ;精度:±1%;功率:62.5mW;最大工作电压:50V;温度系数:±100ppm/℃;; LCSC Part Name: 2.2kΩ ±1% 62.5mW 厚膜电阻; Supplier Part: C60490; Manufacturer: UNI-ROYAL(厚声); Supplier Footprint: 0402; JLCPCB Part Class: 基础库; Datasheet: https://atta.szlcsc.com/upload/public/pdf/source/20200306/C422600_1E6D84923E4A46A82E41ADD87F860B5C.pdf; Supplier: LCSC; Type: 厚膜电阻; Tolerance: ±1%; Power(Watts): 62.5mW; Overload Voltage (Max): 50V; Temperature Coefficient: ±100ppm/℃; Operating Temperature Range: -55℃~+155℃
R236 = 0402WGF1002TCE: 功率:1/16W;精度:±1%;温度系数:±100ppm/℃;阻值:10kΩ;最大工作电压:50V;工作温度范围:-55℃~+155℃;; LCSC Part Name: 10KΩ ±1%; Supplier Part: C25744; Manufacturer: UNI-ROYAL(厚声); Supplier Footprint: 0402; JLCPCB Part Class: Basic Part; Datasheet: https://atta.szlcsc.com/upload/public/pdf/source/20170920/C25744_1505901522148983320.pdf; Supplier: LCSC; Power(Watts): 1/16W; Tolerance: ±1%; Temperature Coefficient: ±100ppm/℃; Overload Voltage (Max): 50V; Operating Temperature Range: -55℃~+155℃
R291 = 0402WGF2201TCE: 电阻类型:厚膜电阻;阻值:2.2kΩ;精度:±1%;功率:62.5mW;最大工作电压:50V;温度系数:±100ppm/℃;; LCSC Part Name: 2.2kΩ ±1% 62.5mW 厚膜电阻; Supplier Part: C25879; Manufacturer: UNI-ROYAL(厚声); Supplier Footprint: 0402; JLCPCB Part Class: 基础库; Datasheet: https://atta.szlcsc.com/upload/public/pdf/source/20200306/C422600_1E6D84923E4A46A82E41ADD87F860B5C.pdf; Supplier: LCSC; Type: 厚膜电阻; Tolerance: ±1%; Power(Watts): 62.5mW; Overload Voltage (Max): 50V; Temperature Coefficient: ±100ppm/℃; Operating Temperature Range: -55℃~+155℃
R292 = 0402WGF3301TCE: 电阻类型:厚膜电阻;阻值:3.3kΩ;精度:±1%;功率:62.5mW;最大工作电压:50V;温度系数:±100ppm/℃;; LCSC Part Name: 3.3kΩ ±1% 62.5mW 厚膜电阻; Supplier Part: C25890; Manufacturer: UNI-ROYAL(厚声); Supplier Footprint: 0402; JLCPCB Part Class: Basic Part; Datasheet: https://atta.szlcsc.com/upload/public/pdf/source/20200306/C422600_1E6D84923E4A46A82E41ADD87F860B5C.pdf; Supplier: LCSC; Type: 厚膜电阻; Tolerance: ±1%; Power(Watts): 62.5mW; Overload Voltage (Max): 50V; Temperature Coefficient: ±100ppm/℃; Operating Temperature Range: -55℃~+155℃
R318 R326 = Res_0603: Supplier Footprint: 0603
U2 = EA3059: 电源电压:2.7V~5.5V;最大充电电流:-;电池类型:-;电池节数:4;; Supplier Part: C111586; Manufacturer: everanalog(申风); Supplier Footprint: QFN-24-EP(4x4); JLCPCB Part Class: 扩展库; Supplier: LCSC; Supply Voltage: 2.7V~5.5V; Number of Cells: 4
U4 U8 U10 U97 U111 U151 U152 = ETA3521FSG: Supplier Part: C2856290; Supplier Footprint: SOT-563-6; JLCPCB Part Class: 扩展库; Supplier: LCSC
U5 = TP4056_C725790: 工作电压:3.7V~6.5V;最大充电电流:1A;电池类型:锂离子;电池节数:1;; LCSC Part Name: 1A独立式线性锂离子电池充电器; Supplier Part: C725790; Manufacturer: UMW(友台半导体); Supplier Footprint: ESOP-8; JLCPCB Part Class: Extended Part; Datasheet: https://item.szlcsc.com/datasheet/TP4056/772193.html; Supplier: LCSC; The Chip Type: 线性充电芯片; Voltage - Supply: 3.7V~6.5V; Charge Current - Max: 1A; Charging Saturation Voltage: 4.2V; Type of Battery: 锂离子; Number of Cells: 1; Operating Temperature: -40℃~+85℃; Battery Temperature Detection: 支持; 0V Battery Charge: 支持; Supply Current (Iq): 35uA
U148 = TPS61023DRLR: 功能类型:升压型;输出类型:可调;工作电压:500mV~5.5V;输出电压:2.2V~5.5V;输出电流:3A;; Supplier Part: C919459; Manufacturer: TI(德州仪器); Supplier Footprint: SOT-563; JLCPCB Part Class: Extended Part; Datasheet: https://www.ti.com.cn/cn/lit/ds/symlink/tps61023.pdf?ts=1728812468331&ref_url=https%253A%252F%252Fwww.ti.com.cn%252Fproduct%252Fcn%252FTPS61023; Supplier: LCSC; Function: 升压型; Output Type: 可调; Voltage - Supply: 500mV~5.5V; Output Voltage: 2.2V~5.5V; Output Current: 3A; Frequency - Switching: 1MHz; Operating Temperature: -40℃~+125℃@(TJ); Synchronous Rectifier: 是; Number of Outputs: 1; Topology: 升压式; Switch tube (built-in/external): 内置
U149 = SGM61230XTN6G/TR: 功能类型:降压型;输出类型:-;工作电压:4.5V~28V;输出电流:3A;; LCSC Part Name: 4.5V至28V输入，3A输出同步降压转换器; Supplier Part: C2692352; Manufacturer: SGMICRO(圣邦微); Supplier Footprint: TSOT-23-6; JLCPCB Part Class: Extended Part; Datasheet: https://item.szlcsc.com/datasheet/SGM61230XTN6G%252FTR/2805312.html; Supplier: LCSC; Function: 降压型; Voltage - Supply: 4.5V~28V; Output Current: 3A; Frequency - Switching: 410kHz; Operating Temperature: -40℃~+125℃@(TJ); Synchronous Rectifier: 是; Number of Outputs: 1; Topology: 降压式; Switch tube (built-in/external): 内置
U155 = YZ104614067F-03020-02: 类型:弹簧顶针(POGO PIN);总PIN数:3P;间距:3mm;全长/全高:6.7mm;工作高度:5.5mm;接触电阻:50mΩ;弹性寿命:10000次;额定电流:2A;额定电压:12V;触头材质:黄铜;触头镀层:金;工作温度:-40℃~+85℃;; LCSC Part Name: 侧贴弹簧顶针连接器; Supplier Part: C5296820; Manufacturer: Xinyangze(鑫扬泽); JLCPCB Part Class: Extended Part; Datasheet: https://item.szlcsc.com/datasheet/YZ104614067F-03020-02/6042750.html; Supplier: LCSC; Type: 弹簧顶针(POGO PIN); Number of Pins: 3P; Pitch: 3mm; Overall Length/Height: 6.7mm; Operational Height: 5.5mm; Contact Resistance: 50mΩ; Elastic Life: 10000次; Current Rating: 2A; Voltage Rating: 12V; Contact Material: 黄铜; Contact Plating: 金; Operating Temperature: -40℃~+85℃
USB12 = TYPE-C 24P QCHT: 连接器类型:Type-C;标准:USB 3.1;公母:母;安装方式:卧贴;触点数量:24P;端口数量:1;额定电流 - 电源:3A;工作温度范围:-40℃~+85℃;; LCSC Part Name: Type-C 母 卧贴; Supplier Part: C456013; Manufacturer: SHOU HAN(首韩); Supplier Footprint: SMD; JLCPCB Part Class: Extended Part; Datasheet: https://atta.szlcsc.com/upload/public/pdf/source/20191113/C456013_92427D6B1C851D10A4627E39D5976A1B.pdf; Supplier: LCSC; Connector Type: Type-C; Standard: USB 3.1; Gender: 母; Mounting Style: 卧贴; Number of Contacts: 24P; Number of Ports: 1; Current Rating - Power (Max): 3A; Operating Temperature Range: -40℃~+85℃; Rated Voltage (Max): 30V; Connect-Disconnect Life: 1万次; Core Colour: 黑色
CARD1 = TF-01A_C2889258: 卡连接方式:自弹式;卡类型:MicroSD卡(TF卡);连接器类型:卡座;本体最大高度:2mm;工作温度范围:-;; LCSC Part Name: 自弹式 MicroSD卡(TF卡) 卡座; Supplier Part: C2889258; Manufacturer: Yuandi(元迪); Supplier Footprint: SMD; Datasheet: https://atta.szlcsc.com/upload/public/pdf/source/20210830/44259D2B93BF4B637A446EF1520C4989.pdf; Supplier: LCSC; Card Connection Mode: 自弹式; Card Type: MicroSD卡(TF卡); Connector Type: 卡座; Maximum Body Height: 2mm
CARD2 = TF-021B-H265: 卡连接方式:拔插式;卡类型:MicroSD卡(TF卡);连接器类型:卡座;本体最大高度:2.5mm;工作温度范围:-25℃~+75℃;; LCSC Part Name: 拔插式 MicroSD卡(TF卡) 卡座; Supplier Part: C498185; Manufacturer: SOFNG(硕方); Supplier Footprint: SMD; JLCPCB Part Class: 扩展库; Datasheet: https://atta.szlcsc.com/upload/public/pdf/source/20200318/C498185_790264C8C4D0E25CCBD64FEBD13A33FF.pdf; Supplier: LCSC; Card Connection Mode: 拔插式; Card Type: MicroSD卡(TF卡); Connector Type: 卡座; Maximum Body Height: 2.5mm; Operating Temperature Range: -25℃~+75℃
LED1 = LED_0402-R: Supplier Footprint: 0402
LED2 = LED_0402-B: Supplier Footprint: 0402
TP18-TP23 TP27-TP30 = Test-Point: Test Point 测试点
U131 = SG2002
X1 = XL7EL89CKI-111YLC-25M: 晶振类型:贴片晶振;频率:25MHz;常温频差:±10ppm;外接负载电容:8pF;频率稳定度(全温):±20ppm;; LCSC Part Name: 25MHZ 8PF ±10PPM YSX211SL; Supplier Part: C19711739; Manufacturer: YXC(扬兴晶振); Supplier Footprint: SMD2016-4P; JLCPCB Part Class: 扩展库; Datasheet: https://atta.szlcsc.com/upload/public/pdf/source/20240329/C26C9A15A73CBCFBF373B30A8E126750.pdf; Supplier: LCSC; Crystal Type: 贴片晶振; Normal temperature Frequency Tolerance: ±10ppm; External load capacitor: 8pF; Frequency Stability(Full temperature range): ±20ppm; Operating Temperature: -40℃~+85℃
JP3 = U.FL-R-SMT-1(80)_C88374: LCSC Part Name: 3310472280，IPE-X板端 IPX接头，贴片; Supplier Part: C88374; Manufacturer: HRS(广濑); Supplier Footprint: SMD; JLCPCB Part Class: 扩展库; Datasheet: https://atta.szlcsc.com/upload/public/pdf/source/20161125/1480067868647.pdf; Supplier: LCSC
L5 = L_0402
U3 = AIC8800D-44Pin: 欧智通 N240 模块

## Nets
0V9_NAT: C324.2 C326.2 L19.2 R204.1 U8.6(OUT)
1V05_HUB: C115.2 C117.2 L8.2 R291.1 U111.6(OUT)
1V8_HDMI: C149.2 L9.2 R9.2 R234.2 U97.6(OUT) ; also on sheet 6
3V3_HDMI_MUX: C520.2 C522.1 L33.2 R458.1 U152.6(OUT) ; also on sheet 6
3V3_HUB: C104.2 C107.1 L6.2 R289.1 U10.6(OUT) ; also on sheet 4
3V3_NAT: C26.2 C30.1 L1.2 R11.1 U4.6(OUT) ; also on sheet 5
3V3_WIFI_TFT_CH347: C39.2 C40.2 C516.2 C518.1 C525.2 C526.2 L32.2 R32.1 R388.1 R389.1 R390.1 R391.1 R392.1 R393.1 R396.1 R455.1 U3.9(VBAT) U3.22(VDDIO) U151.6(OUT) ; also on sheet 8 9
5V-20V: C168.2 C169.1 C497.2 C499.2 M2.1(S) M2.2(S) M2.3(S) M3.1(S) M3.2(S) M3.3(S) R323.1 R324.2 R444.2 U149.3(VIN)
GND: BAT1.2 C1.1 C2.1 C3.1 C4.1 C5.1 C6.1 C7.1 C8.1 C9.1 C10.1 C11.1 C12.1 C13.1 C14.1 C15.1 C16.1 C17.1 C18.1 C19.1 C20.1 C23.1 C25.1 C26.1 C29.1 C31.1 C35.1 C36.1 C37.1 C38.1 C39.1 C40.1 C45.1 C102.1 C103.1 C104.1 C117.1 C148.1 C149.1 C160.1 C324.1 C325.1 C387.1 C388.1 C389.1 C444.1 C445.1 C447.1 C489.1 C490.1 C492.1 C493.1 C497.1 C499.1 C502.1 C509.1 C510.1 C511.1 C512.1 C516.1 C517.1 C520.1 C521.1 C523.1 C524.1 C525.1 C526.1 C527.1 C533.1 C534.1 C567.1 CARD1.6(VSS) CARD1.10(GND) CARD1.11(GND) CARD1.12(GND) CARD1.13(GND) CARD2.6(VSS) CARD2.9 CARD2.10 JP3.2(GND) JP3.3(GND) LED1.1(C) LED2.1(C) M4.2(S) M5.2(S) M6.2(S) M7.2(S) R2.2 R4.2 R12.1 R14.1 R16.2 R17.2 R22.1 R27.2 R46.1 R47.1 R54.1 R236.1 R290.1 R292.1 R319.1 R320.1 R325.1 R327.1 R378.2 R380.2 R384.1 R386.1 R387.1 R440.1 R442.1 R445.1 R456.1 R459.1 R464.1 R465.1 R467.1 R473.1 R474.1 TP20.1 TP23.1 TP28.1 TP30.1 U2.1(GND3) U2.4(AGND) U2.6(GND2) U2.13(GND1) U2.18(GND4) U2.25(EP) U3.1(GND) U3.3(GND) U3.5(GND) U3.20(GND) U3.31(GND) U3.33(GND) U3.36(GND) U4.1(GND) U5.3(GND) U5.9(EP) U8.1(GND) U10.1(GND) U97.1(GND) U111.1(GND) U131.1(VSS18A) U131.14(SD0_CD) U131.42(PTEST) U131.89(EPAD) U148.4(GND) U149.1(GND) U151.1(GND) U152.1(GND) USB12.25(EH) USB12.A1(GND) USB12.A8(SBU1) USB12.A12(GND) USB12.B1(GND) USB12.B8(SBU2) USB12.B12(GND) X1.2(GND) X1.4(GND) ; also on sheet 4 5 6 7 8 9
VBAT: BAT1.1 C490.2 L30.1 LED4.3(+) R466.2 U5.5(BAT) U148.3(VIN) U155.2
VBAT_5V: C35.2 C36.2 C37.2 C38.2 C102.2 C444.2 C445.2 C492.2 C493.2 C517.2 C533.2 C534.2 R18.1 R18.2 R21.1 R21.2 R22.2 R383.1 R383.2 R384.2 R385.1 R385.2 R386.2 R387.2 R439.2 R457.2 R461.1 U2.3(VCC) U2.8(VIN2) U2.9(EN2) U2.10(EN1) U2.11(VIN1) U2.20(VIN4) U2.21(EN4) U2.22(EN3) U2.23(VIN3) U10.3(VIN) U148.6(VOUT) U151.3(VIN) ; also on sheet 4 7 9
VBUS_DOWN: C387.2 M2.5(D) R40.2 R326.2 USB12.A4(VBUS) USB12.A9(VBUS) USB12.B4(VBUS) USB12.B9(VBUS)
VBUS_MON_D: R46.2 R298.1 ; also on sheet 6
VBUS_MON_U: R47.2 R299.1 ; also on sheet 6
VBUS_UP: M3.5(D) R41.2 R318.2 R471.1 ; also on sheet 4
VDD0V9_CPU: C15.2 C16.2 C17.2 C18.2 C19.2 C447.2 C448.2 L28.1 R381.2 U131.9(VDDC) U131.16(VDDC) U131.50(VDDC) U131.61(VDDC) U131.71(VDDC)
VDD1V8_SYS: C11.2 C12.2 C13.2 C14.2 C25.2 C446.2 C527.2 L26.1 R1.1 R3.1 R8.1 R379.2 R469.2 R470.2 U131.5(VDD18A) U131.36(VDDIO_RTC) U131.60(USB_VBUS_DET) U131.68(VDD18A) U131.82(VDD18A) ; also on sheet 8
VDD1V35_DRAM: C6.2 C7.2 C31.2 C32.2 L27.1 R382.2 U131.31(VDDQ_DRAM) U131.32(VDDQ) U131.33(VDDQ) U131.34(VDDQ_DRAM)
VDD3V3_SYS: C1.2 C2.2 C3.2 C4.2 C5.2 C23.2 C24.2 C45.2 C160.2 CARD1.4(VDD) CARD2.4(VDD) L25.1 R5.1 R7.1 R10.2 R49.2 R404.2 R405.2 R406.2 R407.2 U131.13(VDDIO_SD0_EMMC) U131.57(VDDIO_SD1) U131.66(VDD33A)
VDDC_RTC: C8.2 U131.37(VDDC_RTC)
VIN_5V: C29.2 C103.2 C148.2 C325.2 C489.2 C502.2 C521.2 C524.2 C567.2 L34.1 R235.2 R443.2 R460.2 U4.3(VIN) U5.4(VCC) U5.8(CE) U8.3(VIN) U97.3(VIN) U111.3(VIN) U152.3(VIN) ; also on sheet 6
ADC1: C523.2 R466.1 R467.2 U131.59(ADC1)
ANT: C512.2 L5.2 U3.2(WL_BT_ANT)
AUD_IN: U131.2(AUD_AINL_MIC)
AUD_OUT: U131.4(AUD_AOUTR)
AUD_VREF: C9.2 C10.2 U131.3(AUD_AVREF)
BB_DN: R479.2 ; also on sheet 6
BB_DP: R480.2 ; also on sheet 6
BOOT: R7.2 TP29.1 U131.30(AUX0)
BT_CTS: R395.1 U3.44(UART1_CTS)
BT_RTS: R34.1 U3.41(UART1_RTS)
BT_RX: R39.1 U3.43(UART1_RX)
BT_TX: R394.1 U3.42(UART1_TX)
CAM_IO0: U131.48(PWR_GPIO1)
CAM_SCL: R469.1 U131.43(PWR_WAKEUP) ; also on sheet 8
CAM_SDA: R470.1 U131.44(PWR_BUTTON) ; also on sheet 8
CH347_DTR1: R395.2 U131.26(JTAG_TMS) ; also on sheet 9
CH347_RST#: R34.2 U131.27(JTAG_TCK) ; also on sheet 9
CH347_RTS1: R39.2 TP22.1 U131.28(IIC0_SCL) ; also on sheet 9
CHRG: R20.1 U5.7(CHRG#)
CPU_CEL: R1.2 R2.1 U131.67(EPHY_RTX)
DFP_CC1: C388.2 USB12.A5(CC1) ; also on sheet 6
DFP_CC2: C389.2 USB12.B5(CC2) ; also on sheet 6
DOWN_VBUS_DIS: M4.1(G) R327.2 ; also on sheet 6
DOWN_VBUS_EN: M6.1(G) R325.2 ; also on sheet 6
EN_EXT09V: R111.2
EPHY_RXN: U131.62(EPHY_RXN)
EPHY_RXP: U131.63(EPHY_RXP)
EPHY_TXN: U131.64(EPHY_TXN)
EPHY_TXP: U131.65(EPHY_TXP)
FB1: C24.1 R10.1 R378.1 U2.14(FB1)
FB2: C446.1 R379.1 R380.1 U2.5(FB2)
FB3: C32.1 R16.1 R382.1 U2.2(FB3)
FB4: C448.1 R17.1 R381.1 U2.17(FB4)
GPIOA_14: R6.1 U131.15(SD0_PWR_EN)
GPIOA_26: R397.2 R398.2 U131.20(EMMC_DAT2)
GPIOA_29: D31.1(K) R394.2 R474.2 TP21.1 U131.29(IIC0_SDA)
HOST_WAKE_WF: R396.2 R398.1 U3.24(HOST_WAKE_WF)
LX1: L25.2 U2.12(LX1)
LX2: L26.2 U2.7(LX2)
LX3: L27.2 U2.24(LX3)
LX4: L28.2 U2.19(LX4)
POWUSB_DN: R479.1 USB12.A7(D-) USB12.B7(D-)
POWUSB_DP: R480.1 USB12.A6(D+) USB12.B6(D+)
PWR_DET: R3.2 R4.1 U131.38(PWR_VBAT_DET)
RSTN: C20.2 R8.2 TP27.1 U131.39(PWR_RSTN)
SD0_CLK: CARD1.5(CLK) CARD2.5(CLX) U131.6(SD0_CLK)
SD0_CMD: CARD1.3(CMD) CARD2.3(CMD) R407.1 U131.7(SD0_CMD)
SD0_D0: CARD1.7(DAT0) CARD2.7(DAT0) R404.1 U131.8(SD0_D0)
SD0_D1: CARD1.8(DAT1) CARD2.8(DAT1) R405.1 U131.10(SD0_D1)
SD0_D2: CARD1.1(DAT2) CARD2.1(DAT2) R49.1 U131.11(SD0_D2)
SD0_D3: CARD1.2(CD/DAT3) CARD2.2(CD/DAT3) R406.1 U131.12(SD0_D3)
SD1_CLK: R391.2 U3.17(SDIO_DATA_CLK) U131.56(SD1_CLK)
SD1_CMD: R390.2 U3.16(SDIO_DATA_CMD) U131.55(SD1_CMD)
SD1_D0: R392.2 U3.18(SDIO_DATA_0) U131.54(SD1_D0)
SD1_D1: R393.2 U3.19(SDIO_DATA_1) U131.53(SD1_D1)
SD1_D2: R32.2 U3.14(SDIO_DATA_2) U131.52(SD1_D2)
SD1_D3: R389.2 U3.15(SDIO_DATA_3) U131.51(SD1_D3)
SOC_OTG_DM: U131.70(USB_DM) ; also on sheet 4
SOC_OTG_DP: U131.69(USB_DP) ; also on sheet 4
SPI0_CS: U131.84(MIPI_TX2P) ; also on sheet 8
SPI0_SCK: U131.83(MIPI_TX2N) ; also on sheet 8
SPI0_SDI: U131.86(MIPI_TX1P)
SPI0_SDO: U131.85(MIPI_TX1N) ; also on sheet 8
STDBY: R31.1 U5.6(STDBY#)
TFT_DC: U131.17(SPK_EN) ; also on sheet 8
TFT_RST: U131.23(EMMC_DAT3) ; also on sheet 8
TP0_INT: U131.40(PWR_SEQ1) ; also on sheet 8
TP0_RST: U131.41(PWR_SEQ2) ; also on sheet 8
UART0_RX: TP18.1 U131.19(UART0_RX)
UART0_TX: TP19.1 U131.18(UART0_TX)
UP_VBUS_DIS: M7.1(G) R319.2 ; also on sheet 6
UP_VBUS_EN: M5.1(G) R320.2 ; also on sheet 6
WF_PWR_EN: R388.2 R397.1 U3.12(WL_PWR)
WIRED_POW: R13.1 R462.1 R472.1 R473.2 U155.1 ; also on sheet 4 7
WIRELESS_POW: D30.1(K) R464.2 U148.2(EN) U155.3
XTAL_XIN: C509.2 R454.2 U131.45(XTAL_XIN) X1.3
XTAL_XOUT: C510.2 R454.1 U131.46(XTAL_XOUT) X1.1
$1N16315: LED2.2(A) R6.2
$1N16318: LED1.2(A) R5.2
$4N6118: C169.2 M2.4(G) R322.2
$4N6132: L6.1 U10.2(SW)
$4N6133: C107.2 R289.2 R290.2 U10.5(FB)
$4N6167: C168.1 M3.4(G) R321.2
$4N6168: M5.3(D) R321.1 R323.2
$4N6169: M6.3(D) R322.1 R324.1
$4N6172: M7.3(D) R318.1
$4N6174: M4.3(D) R326.1
$4N6945: R41.1 R299.2
$4N6948: R40.1 R298.2
$4N42396: R9.1 R234.1 R236.2 U97.5(FB)
$4N42397: L9.1 U97.2(SW)
$4N42399: R235.1 U97.4(EN)
$4N42416: L30.2 U148.5(SW)
$4N42417: R439.1 R440.2 U148.1(FB)
$4N42426: C496.2 L34.2 U149.2(SW)
$4N42428: C496.1 U149.6(BOOT)
$4N42434: C503.2 R441.1 R442.2 U149.4(FB)
$4N42452: C503.1 R441.2 R443.1
$4N42459: R444.1 R445.2 U149.5(EN)
$4N42465: C518.2 R455.2 R456.2 U151.5(FB)
$4N42468: R457.1 U151.4(EN)
$4N42469: L32.1 U151.2(SW)
$4N42474: C522.2 R458.2 R459.2 U152.5(FB)
$4N42477: R460.1 U152.4(EN)
$4N42478: L33.1 U152.2(SW)
$4N42482: D30.2(A) Q1.2(S) R463.2
$4N42486: R461.2 U10.4(EN)
$4N42503: Q1.3(D) R471.2
$4N42505: Q1.1(G) R472.2
$4N42509: D31.2(A) R463.1 R465.2
$4N42516: C30.2 R11.2 R12.2 U4.5(FB)
$4N42520: R13.2 U4.4(EN)
$4N42521: L1.1 U4.2(SW)
$4N42528: R14.2 U5.1(TEMP)
$4N42531: R27.1 U5.2(PROG)
$4N42537: LED4.1(R-) R20.2
$4N42539: LED4.2(UG-) R31.2
$5N4407: C511.2 JP3.1(SIG) L5.1
Net-(C115-1): C115.1 R291.2 R292.2 U111.5(FB)
Net-(C326-1): C326.1 R54.2 R204.2 U8.5(FB)
Net-(L8-1): L8.1 U111.2(SW)
Net-(L19-1): L19.1 U8.2(SW)
Net-(R111-1): R111.1 U8.4(EN)
Net-(R462-2): R462.2 U111.4(EN)

Not connected (* = marked no-connect by the designer): CARD1 9(CD)*; U2 15(NC)* 16(NC)*; U3 4(NC)* 6(HOST_WAKE_BT)* 7(BT_WAKE_HOST)* 8(NC)* 10(USB DM)* 11(USB DP)* 13(WL_WAKE_HOST)* 21(NC)* 23(GPIO_B4)* 25(PCM_DOUT)* 26(PCM_CLK)* 27(PCM_DIN)* 28(PCM_SYNC)* 29(UART0 TX)* 30(UART0 RX)* 32(NC)* 34(NC)* 35(GPIOB6)* 37(NC)* 38(NC)* 39(NC)* 40(NC)*; U131 21(EMMC_CLK) 22(EMMC_DAT0) 24(EMMC_CMD) 25(EMMC_DAT1) 35(GPIO_ZQ) 47(PWR_GPIO0) 49(PWR_GPIO2) 58(PWM0_BUCK) 72(MIPI_RX4N) 73(MIPI_RX4P) 74(MIPI_RX3N) 75(MIPI_RX3P) 76(MIPI_RX2N) 77(MIPI_RX2P) 78(MIPI_RX1N) 79(MIPI_RX1P) 80(MIPI_RX0N) 81(MIPI_RX0P) 87(MIPI_TX0N) 88(MIPI_TX0P); USB12 A2(TX1+) A3(TX1-) A10(RX2-) A11(RX2+) B2(TX2+) B3(TX2-) B10(RX1-) B11(RX1+)

## Notes on the sheets
sheet 1
- GPIO20
- GPIO16
- GPIO17
- GPIOA27
- GPIOA23
- GPIOA24
sheet 2
- Device
- DNP (Without RC)
- wired_pow=H && wireless_pow=H  有线模式
  wired_pow=L && wireless_pow=H  无线模式
  wired_pow=L && wireless_pow=L  关机状态
- 匹配改为1.05
